# Altium schematic sheet MultiVibrateur.SchDoc
size A4; SheetNumber: 1; SheetTotal: 1
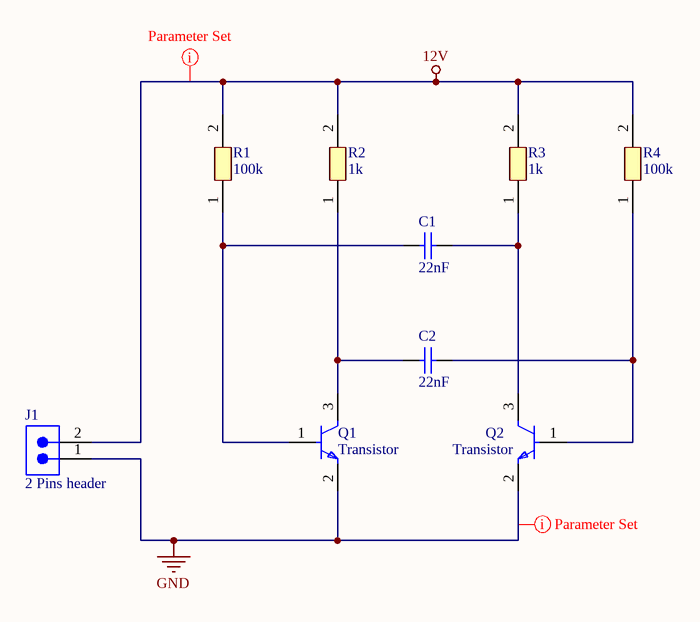
[diagram p0: MultiVibrateur.SchDoc]

## Parts
C1  22nF  [CAPACITOR_1206]
C2  22nF  [CAPACITOR_1206]
J1  2 Pins header  [HEADER_2PIN_2_54]
Q1  Transistor  [TRANSISTOR_BC847]
Q2  Transistor  [TRANSISTOR_BC847]
R1  100k  [RESISTOR_1206]
R2  1k  [RESISTOR_1206]
R3  1k  [RESISTOR_1206]
R4  100k  [RESISTOR_1206]

## Nets
12V: J1.2 R1.2 R2.2 R3.2 R4.2
GND: J1.1 Q1.2(E) Q2.2(E)
NetC1_1: C1.1 Q1.1(B) R1.1
NetC1_2: C1.2 Q2.3(C) R3.1
NetC2_1: C2.1 Q1.3(C) R2.1
NetC2_2: C2.2 Q2.1(B) R4.1

## Layout directives
rule Supply Nets [Voltage = 12.00]: 12V
net class Power: GND

## Library data of the parts
C1 C2 = Capacitor: Rated Voltage: 100 V; Value: 100nF; Case-Metric: 3216; Case-EIA: 1206; Tolerance: Â±5%; Technology: SMT; Max Thickness: 1.7 mm
J1 = 2 Pins header: PartNumber: TSW-102-26-F-S; Manufacturer: Samtec; Pitch: 2.54 mm; PackageVersion: DM, 8/1988; ComponentLink2Description: Datasheet; PackageReference: TSW-102-26-XX-S; ComponentLink3URL: http://www.samtec.com/documents/webfiles/cpdf/TSW-XXX-XX-XXX-X-XX-XXX-MKT.pdf; ComponentLink2URL: http://www.samtec.com/documents/webfiles/pdf/TSW_TH.PDF; ComponentLink1Description: Manufacturer URL; DatasheetVersion: F-214; RoHS: True; ComponentLink3Description: Package Specification; Temperature Range: -55 to 125 degC; Orientation: Vertical; ComponentLink1URL: http://www.samtec.com; PackageDescription: .025[0.64] SQ. Post Terminal Strip Assembly; Mounting Technology: Through-hole
R1-R4 = Resistor
Q1 Q2 = Transistor: RoHS Compliant: Yes